# Altium project Relay-Switching-Board-v2.0.PrjPcb (part 4 of 4)

## Sheet Relay-Sheet.SchDoc
size 420 x 297 mm; SheetNumber: 5; SheetTotal: 5
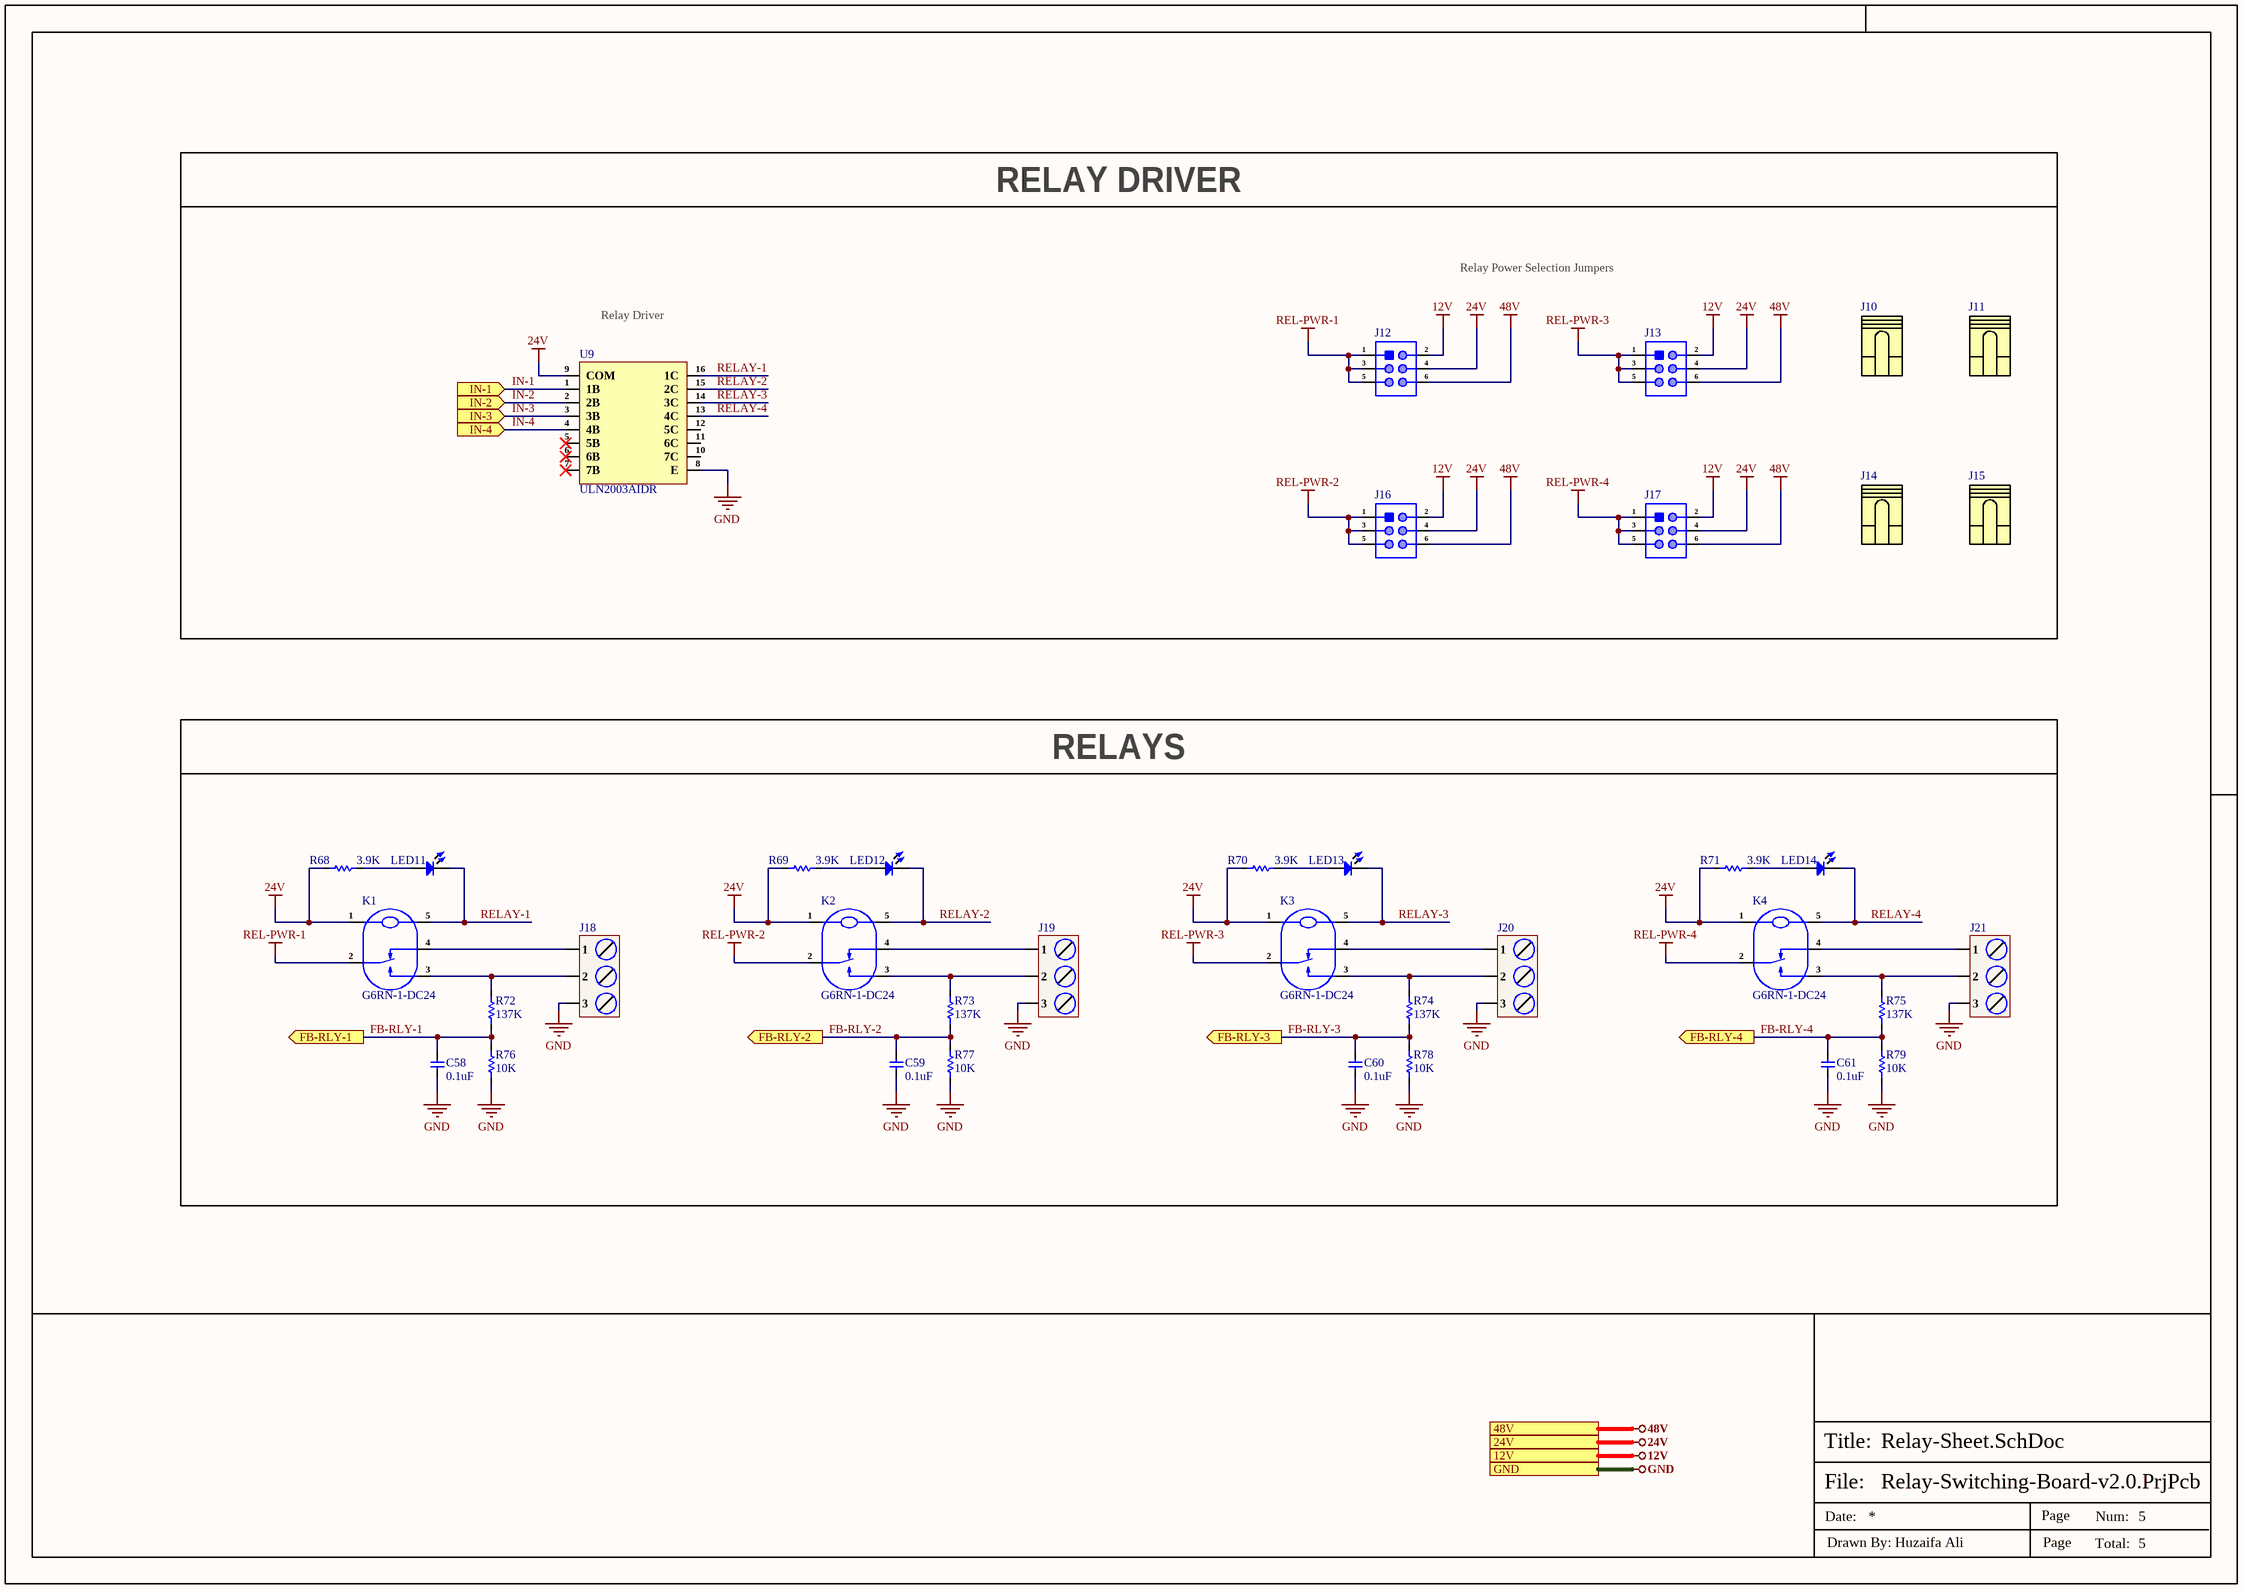
[diagram p3: Relay-Sheet.SchDoc]

### Parts
C58  0.1uF  [Cap-0603]
C59  0.1uF  [Cap-0603]
C60  0.1uF  [Cap-0603]
C61  0.1uF  [Cap-0603]
J10  Shunt (X2541-A1NIB)  (value not drawn)  (graphical)
J11  Shunt (X2541-A1NIB)  (value not drawn)  (graphical)
J12  X6521WV-2x03H-C60D30  [X6521WV-2x03H-C60D30]  (value not drawn)
J13  X6521WV-2x03H-C60D30  [X6521WV-2x03H-C60D30]  (value not drawn)
J14  Shunt (X2541-A1NIB)  (value not drawn)  (graphical)
J15  Shunt (X2541-A1NIB)  (value not drawn)  (graphical)
J16  X6521WV-2x03H-C60D30  [X6521WV-2x03H-C60D30]  (value not drawn)
J17  X6521WV-2x03H-C60D30  [X6521WV-2x03H-C60D30]  (value not drawn)
J18  DB128L-5.08-3P-GY-S  [DB128L-5.08-3P-GY-S]  (value not drawn)
J19  DB128L-5.08-3P-GY-S  [DB128L-5.08-3P-GY-S]  (value not drawn)
J20  DB128L-5.08-3P-GY-S  [DB128L-5.08-3P-GY-S]  (value not drawn)
J21  DB128L-5.08-3P-GY-S  [DB128L-5.08-3P-GY-S]  (value not drawn)
K1  G6RN-1-DC24  [G6RN-1 DC24]
K2  G6RN-1-DC24  [G6RN-1 DC24]
K3  G6RN-1-DC24  [G6RN-1 DC24]
K4  G6RN-1-DC24  [G6RN-1 DC24]
LED11  Blue  [LED-0603]  (value not drawn)
LED12  Blue  [LED-0603]  (value not drawn)
LED13  Blue  [LED-0603]  (value not drawn)
LED14  Blue  [LED-0603]  (value not drawn)
R68  3.9K  [Res-0402]
R69  3.9K  [Res-0402]
R70  3.9K  [Res-0402]
R71  3.9K  [Res-0402]
R72  137K  [Res-0402]
R73  137K  [Res-0402]
R74  137K  [Res-0402]
R75  137K  [Res-0402]
R76  10K  [Res-0402]
R77  10K  [Res-0402]
R78  10K  [Res-0402]
R79  10K  [Res-0402]
U9  ULN2003AIDR  [16-SOIC (0.154", 3.90mm Width)]

### Blocks framed on the sheet
RELAY DRIVER: J10-J17 U9
RELAYS: C58-C61 J18-J21 K1-K4 LED11-LED14 R68-R79

### Ports
12V (see Top-Sheet[5B], Power-Sheet[4D]), 24V (see Top-Sheet[5B], Power-Sheet[4D]), 48V (see Top-Sheet[5B], Power-Sheet[4D]), FB-RLY-1 (out, see Top-Sheet[4B]), FB-RLY-2 (out, see Top-Sheet[4B]), FB-RLY-3 (out, see Top-Sheet[4B]), FB-RLY-4 (out, see Top-Sheet[4B]), GND (see Top-Sheet[5B], Comms-Sheet[4D], Controller-Sheet[4D], Power-Sheet[4D]), IN-1 (in, see Top-Sheet[4B]), IN-2 (in, see Top-Sheet[4B]), IN-3 (in, see Top-Sheet[4B]), IN-4 (in, see Top-Sheet[4B])

### Nets
12V: J12.2 J13.2 J16.2 J17.2 ; port 12V
24V: J12.4 J13.4 J16.4 J17.4 K1.1 K2.1 K3.1 K4.1 R68.1 R69.1 R70.1 R71.1 U9.9(COM) ; port 24V
48V: J12.6 J13.6 J16.6 J17.6 ; port 48V
GND: C58.1 C59.1 C60.1 C61.1 J18.3 J19.3 J20.3 J21.3 R76.1 R77.1 R78.1 R79.1 U9.8(E) ; port GND
REL-PWR-1: J12.1 J12.3 J12.5 K1.2
REL-PWR-2: J16.1 J16.3 J16.5 K2.2
REL-PWR-3: J13.1 J13.3 J13.5 K3.2
REL-PWR-4: J17.1 J17.3 J17.5 K4.2
FB-RLY-1: C58.2 R72.1 R76.2 ; port FB-RLY-1  [project net DI_PA1]
FB-RLY-2: C59.2 R73.1 R77.2 ; port FB-RLY-2  [project net DI_PA5]
FB-RLY-3: C60.2 R74.1 R78.2 ; port FB-RLY-3  [project net DI_PB0]
FB-RLY-4: C61.2 R75.1 R79.2 ; port FB-RLY-4  [project net DI_PB1]
IN-1: U9.1(1B) ; port IN-1
IN-2: U9.2(2B) ; port IN-2
IN-3: U9.3(3B) ; port IN-3
IN-4: U9.4(4B) ; port IN-4
RELAY-1: K1.5 LED11.2 U9.16(1C)
RELAY-2: K2.5 LED12.2 U9.15(2C)
RELAY-3: K3.5 LED13.2 U9.14(3C)
RELAY-4: K4.5 LED14.2 U9.13(4C)
NetJ18_1: J18.1 K1.4
NetJ18_2: J18.2 K1.3 R72.2
NetJ19_1: J19.1 K2.4
NetJ19_2: J19.2 K2.3 R73.2
NetJ20_1: J20.1 K3.4
NetJ20_2: J20.2 K3.3 R74.2
NetJ21_1: J21.1 K4.4
NetJ21_2: J21.2 K4.3 R75.2
NetLED11_1: LED11.1 R68.2
NetLED12_1: LED12.1 R69.2
NetLED13_1: LED13.1 R70.2
NetLED14_1: LED14.1 R71.2

Not connected (* = marked no-connect by the designer): U9 5(5B)* 6(6B)* 7(7B)* 10(7C) 11(6C) 12(5C)

### Notes on the sheet
- Relay Power Selection Jumpers
- Relay Driver
- File:
- Title:
- Date:
- Page
- Num:
- Total:
- Drawn By: Huzaifa Ali

### Library data of the parts
C58-C61 = CC0603KRX7R0BB104: CAP CER 0.1UF 100V X7R 0603; Manufacturer: Yageo; Capacitance: 100nF; Tolerance: 10%; Item Type: Capacitor; Supplier 1: Digi-Key; Manufacturer Part Number: CC0603KRX7R0BB104; RoHS: Yes; Category: Ceramic Capacitors; Stock 1: 60476; Pricing 1: 1=0.19000, 10=0.13500, 50=0.07680, 100=0.06370, 500=0.04466, 1000=0.03696 (USD); Mount: Surface Mount; Case/Package: 0603; Case Code (Metric): 1608; Case Code (Imperial): 0603; Weight: 7.1E-05oz; Min Operating Temperature: -55°C; Max Operating Temperature: 125°C; Package Quantity: 4000; Voltage Rating: 100V; Packaging: Tape and Reel; Dielectric: X7R; Termination: SMD/SMT; Resistor Type: Ceramic; Voltage Rating (DC): 100V; Series: CC; Length: 0.063inch; Width: 0.031inch; Thickness: 0.035inch; Depth: 0.8mm; Lead Free: Lead Free; RoHS Compliant: Yes; ComponentLink1URL: https://datasheet.ciiva.com/6277/mlccorderingcode-6277030.pdf?src-supplier=Digi-Key; ComponentLink1Description: https://datasheet.ciiva.com/6277/mlccorderingcode-6277030.pdf?src-supplier=Digi-Key; ComponentLink2URL: https://datasheet.ciiva.com/6277/mlccorderingcode-6277081.pdf?src-supplier=Digi-Key; ComponentLink2Description: https://datasheet.ciiva.com/6277/mlccorderingcode-6277081.pdf?src-supplier=Digi-Key; ComponentLink3URL: https://datasheet.ciiva.com/6277/mlccorderingcode-6277082.pdf?src-supplier=Digi-Key; ComponentLink3Description: https://datasheet.ciiva.com/6277/mlccorderingcode-6277082.pdf?src-supplier=Digi-Key; Supplier Part Number 1: 311-1523-1-ND; LCSC Part Number: C113803
J10 J11 J14 J15 = Shunt (X2541-A1NIB): Open top 3A 2.54mm P=2.54mm Shunts, Jumpers ROHS; Manufacturer: XKB Connection; Item Type: Jumper; Manufacturer Part Number: X2541-A1NIB; Package: P=2.54mm; LCSC Part Number: C2938578; ComponentLink1Description: LCSC; ComponentLink1URL: https://www.lcsc.com/product-detail/Shunts-Jumpers_XKB-Connection-X2541-A1NIB_C2938578.html
J12 J13 J16 J17 = X6521WV-2x03H-C60D30: Gold 250V 3A Policy 2.5mm 6P -40℃~+105℃ 2.54mm Double Row Black Brass 2x3P 2.54mm Plugin,P=2.54mm Pin Headers ROHS; Manufacturer: XKB; Item Type: Male Pin Header; Manufacturer Part Number: X6521WV-2x03H-C60D30; Package: Plugin,P=2.54mm; LCSC Part Number: C706893; ComponentLink1Description: LCSC; ComponentLink1URL: https://www.lcsc.com/product-detail/Pin-Headers_XKB-Connection-X6521WV-2x03H-C60D30_C706893.html
J18-J21 = DB128L-5.08-3P-GY-S: 1x3P 20A -40℃~+105℃ 300V Gray 12~30 Direct Insert 5.08mm 1~2.5 1 3 Plugin,P=5.08mm Screw Terminal Blocks ROHS; Manufacturer: DORABO; Manufacturer Part Number: DB128L-5.08-3P-GY-S; Package: Plugin,P=5.08mm; LCSC Part Number: C500022; Item Type: Terminal Block; ComponentLink1Description: LCSC; ComponentLink1URL: https://www.lcsc.com/product-detail/Screw-Terminal-Blocks_DORABO-DB128L-5-08-3P-GY-S_C500022.html
K1-K4 = G6RN-1-DC24: RELAY GEN PURPOSE SPDT 8A 24V; Manufacturer: Omron; Item Type: Relays; Supplier: Rs; LCSC Part Number: C397134; Manufacturer Part Number: G6RN-1-DC24; RoHS: Yes; Stock: 2257; ComponentLink1URL: https://datasheet.ciiva.com/26921/getdatasheetpartid-770308-26921141.pdf?src-supplier=Verical; ComponentLink1Description: https://datasheet.ciiva.com/26921/getdatasheetpartid-770308-26921141.pdf?src-supplier=Verical; ComponentLink2URL: https://datasheet.ciiva.com/8000/1533700-8000602.pdf?src-supplier=Element14; ComponentLink2Description: https://datasheet.ciiva.com/8000/1533700-8000602.pdf?src-supplier=Element14; ComponentLink3URL: https://datasheet.ciiva.com/30072/en-g6rn-30072442.pdf?src-supplier=Onlinecomponents.com; ComponentLink3Description: https://datasheet.ciiva.com/30072/en-g6rn-30072442.pdf?src-supplier=Onlinecomponents.com; ComponentLink4URL: https://datasheet.ciiva.com/5232/g6rn-0911-5232733.pdf?src-supplier=Mouser; ComponentLink4Description: https://datasheet.ciiva.com/5232/g6rn-0911-5232733.pdf?src-supplier=Mouser
LED11-LED14 = NCD0603B3: blue 0603 Light Emitting Diodes (LED) ROHS; Manufacturer: Foshan NationStar Optoelectronics; Manufacturer Part Number: NCD0603B3; Package: 0603; LCSC Part Number: C158101; Item Type: LED; ComponentLink1Description: LCSC; ComponentLink1URL: https://www.lcsc.com/product-detail/Light-Emitting-Diodes-LED_Foshan-NationStar-Optoelectronics-NCD0603B3_C158101.html
R68-R71 = RC0402FR-073K9L: RES 3.9K OHM 1% 1/16W 0402; Manufacturer: Yageo; Temperature Coefficient: 100ppm/°C; Power Rating: 62.5mW; Value: 3.9kR; Voltage Rating: 50V; Max Power Dissipation: 63mW; Item Type: Resistor; Supplier: Future Electronics; Supplier Part Number: 9808155; Manufacturer Part Number: RC0402FR-073K9L; RoHS: Yes; Category: Chip SMD Resistors; Stock: 6910000; Pricing: 10000=0.0011, 100000=0.0011, 300000=0.001, 750000=0.001, 2000000=0.0009 (USD); Case/Package: 0402; Case Code (Imperial): 0402; Case Code (Metric): 1005; Min Operating Temperature: -55°C; Max Operating Temperature: 155°C; Tolerance: 1%; Packaging: Tape and Reel; Resistor Type: Thick Film; Series: RC; Termination: SMD/SMT; Number of Terminations: 2; Features: Moisture Resistant; Resistance Tolerance: 1%; Construction: Rectangular; Voltage Rating (AC): 50V; Length: 1mm; Depth: 0.5mm; Lead Free: Lead Free; RoHS Compliant: Yes; Reach SVHC Compliant: Unknown; Military Standard: Not; ComponentLink1URL: https://datasheet.ciiva.com/12666/pyu-rc0402-51-rohs-l-6-r-12666997.pdf?src-supplier=Mouser; ComponentLink1Description: https://datasheet.ciiva.com/12666/pyu-rc0402-51-rohs-l-6-r-12666997.pdf?src-supplier=Mouser; ComponentLink2URL: https://datasheet.ciiva.com/7849/1018594-7849989.pdf?src-supplier=Element14; ComponentLink2Description: https://datasheet.ciiva.com/7849/1018594-7849989.pdf?src-supplier=Element14; ComponentLink3URL: https://datasheet.ciiva.com/7849/1018594-7849990.pdf?src-supplier=Element14; ComponentLink3Description: https://datasheet.ciiva.com/7849/1018594-7849990.pdf?src-supplier=Element14; ComponentLink4URL: https://datasheet.ciiva.com/15189/getdatasheetpartid-469246-15189453.pdf?src-supplier=Verical; ComponentLink4Description: https://datasheet.ciiva.com/15189/getdatasheetpartid-469246-15189453.pdf?src-supplier=Verical; LCSC Part Number: C131467
R72-R75 = RT0402BRD07137KL: RES SMD 137K OHM 0.1% 1/16W 0402; Manufacturer: Yageo; Item Type: Resistors; Value: 137kR; Max Power Dissipation: 63mW; Temperature Coefficient: 25ppm/°C; Voltage Rating: 50V; Supplier: Digikey; LCSC Part Number: C852519; Manufacturer Part Number: RT0402BRD07137KL; RoHS: Yes; Stock: 18830; Pricing: 1=0.2, 10=0.15, 50=0.1174, 100=0.1051, 500=0.07972, 1000=0.07035, 5000=0.05199 (USD); Case/Package: 0402; Min Operating Temperature: -55°C; Max Operating Temperature: 155°C; Packaging: Tape and Reel; Number of Terminations: 2; Tolerance: 0.1%; Features: Moisture Resistant; Series: RT; Length: 0.039inch; Width: 0.02inch; Height: 0.014inch; ComponentLink1URL: http://www.yageo.com/documents/recent/PYu-RT_1-to-0.01_RoHS_L_8.pdf?src-supplier=Digikey; ComponentLink1Description: http://www.yageo.com/documents/recent/PYu-RT_1-to-0.01_RoHS_L_8.pdf?src-supplier=Digikey
R76-R79 = RT0402BRD0710KL: RES SMD 10K OHM 0.1% 1/16W 0402; Manufacturer: Yageo; Item Type: Resistor; Supplier: Future Electronics; Supplier Part Number: 1236728; Manufacturer Part Number: RT0402BRD0710KL; RoHS: Yes; Category: Chip SMD Resistors; Stock: 490000; Pricing: 10000=0.0218, 20000=0.0213, 30000=0.021, 50000=0.0206, 100000=0.0199 (USD); ComponentLink1URL: https://datasheet.ciiva.com/12836/pyu-rt-1-to-0-05-rohs-l-4-12836454.pdf?src-supplier=Mouser; ComponentLink1Description: https://datasheet.ciiva.com/12836/pyu-rt-1-to-0-05-rohs-l-4-12836454.pdf?src-supplier=Mouser; LCSC Part Number: C190095
U9 = ULN2003AIDR: IC PWR RELAY 7NPN 1:1 16SOIC; Manufacturer: Texas Instruments; Supplier: Mouser; Supplier Part Number: 595-ULN2003AIDR; Manufacturer Part Number: ULN2003AIDR; RoHS: Yes; Item Type: IC; Stock: 2012; Pricing: 1=0.66, 10=0.589, 50=0.589, 100=0.402, 1000=0.285, 10000=0.232 (USD); ComponentLink1URL: https://datasheet.ciiva.com/15139/getdatasheetpartid-47948-15139878.pdf?src-supplier=Verical; ComponentLink1Description: https://datasheet.ciiva.com/15139/getdatasheetpartid-47948-15139878.pdf?src-supplier=Verical; ComponentLink2URL: https://datasheet.ciiva.com/14424/ulq2003a-14424030.pdf?src-supplier=Avnet; ComponentLink2Description: https://datasheet.ciiva.com/14424/ulq2003a-14424030.pdf?src-supplier=Avnet; ComponentLink3URL: https://datasheet.ciiva.com/1700/uln2003ai-1700820.pdf?src-supplier=Digikey; ComponentLink3Description: https://datasheet.ciiva.com/1700/uln2003ai-1700820.pdf?src-supplier=Digikey; ComponentLink4URL: https://datasheet.ciiva.com/1700/uln2003ai-1700821.pdf?src-supplier=Digikey; ComponentLink4Description: https://datasheet.ciiva.com/1700/uln2003ai-1700821.pdf?src-supplier=Digikey; ComponentLink5URL: https://datasheet.ciiva.com/1700/uln2003ai-1700822.pdf?src-supplier=Digikey; ComponentLink5Description: https://datasheet.ciiva.com/1700/uln2003ai-1700822.pdf?src-supplier=Digikey

## Sheet Comms-Sheet.SchDoc
size 420 x 297 mm; SheetNumber: 3; SheetTotal: 5
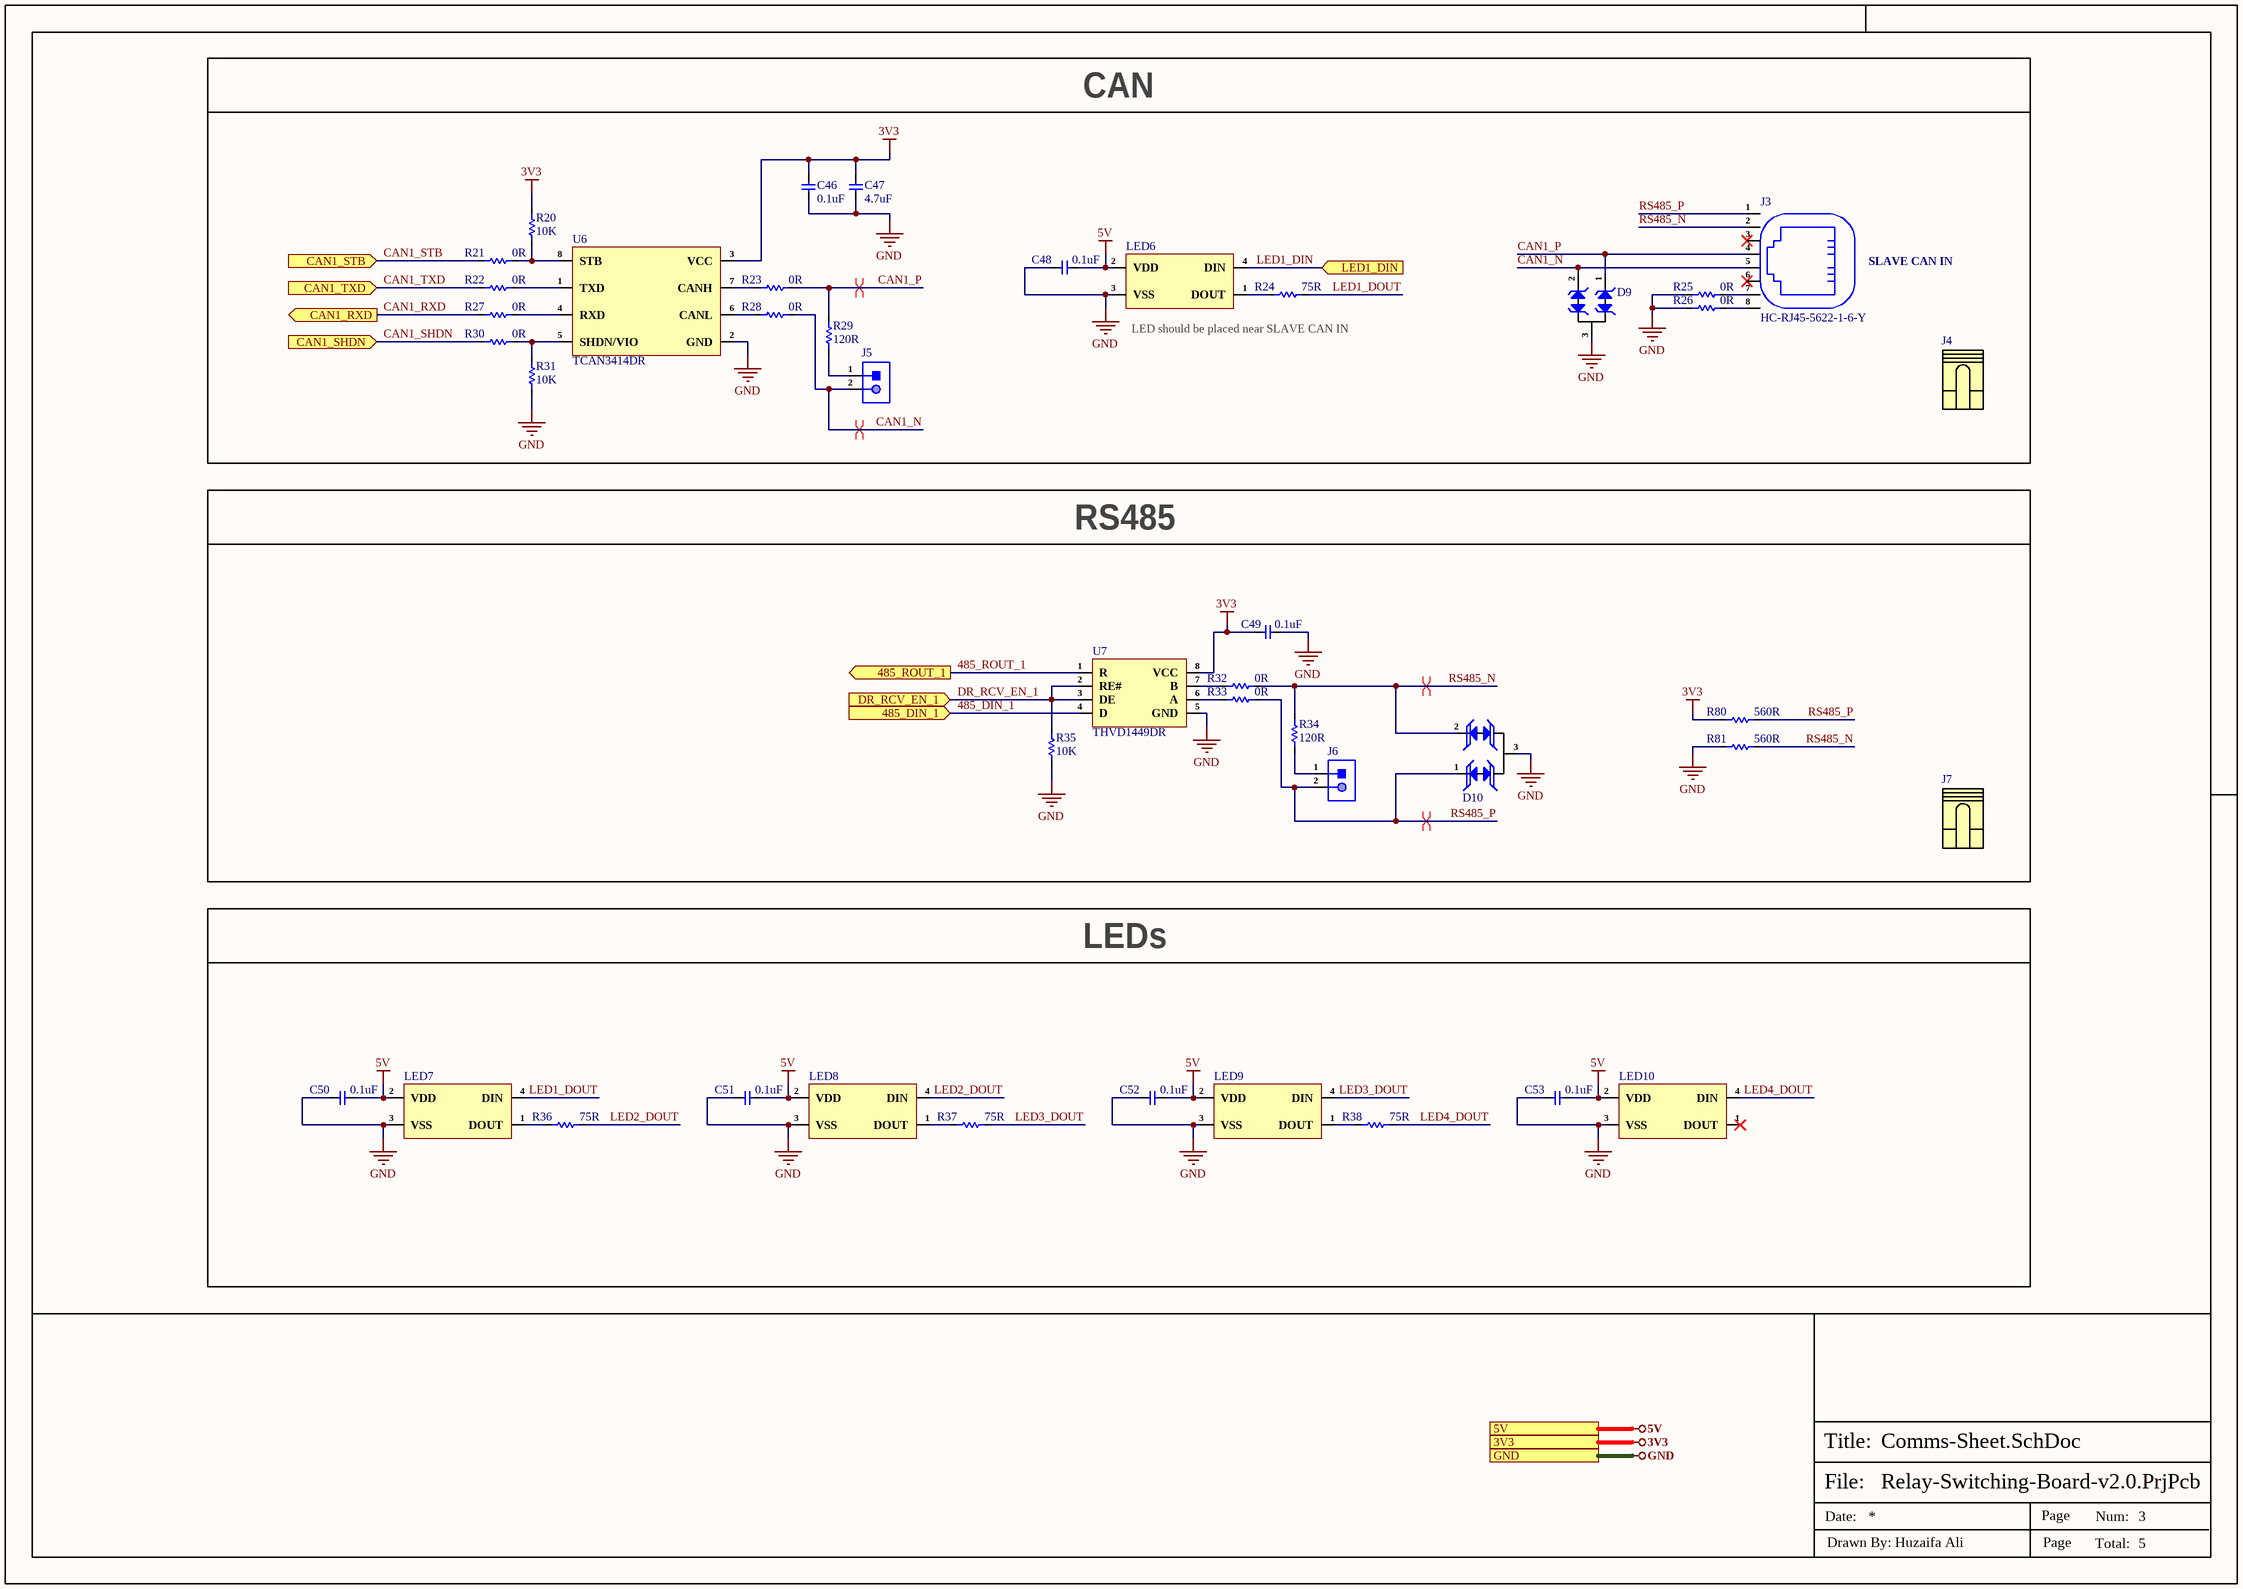
[diagram p4: Comms-Sheet.SchDoc]

### Parts
C46  0.1uF  [Cap-0402]
C47  4.7uF  [Cap-0402]
C48  0.1uF  [Cap-0402]
C49  0.1uF  [Cap-0402]
C50  0.1uF  [Cap-0402]
C51  0.1uF  [Cap-0402]
C52  0.1uF  [Cap-0402]
C53  0.1uF  [Cap-0402]
D9  CDSOT23-T24CAN-Q  [SOT-23]  (value not drawn)
D10  SM712  [SOT-23]  (value not drawn)
J3  HC-RJ45-5622-1-6-Y  [HC-RJ45-5622-1-6-Y]
J4  Shunt (X2541-A1NIB)  (value not drawn)  (graphical)
J5  X6511WV-02H-C60D30  [HDR1X2_]  (value not drawn)
J6  X6511WV-02H-C60D30  [HDR1X2_]  (value not drawn)
J7  Shunt (X2541-A1NIB)  (value not drawn)  (graphical)
LED6  WS2812D-F5  [WS2812D-F5]  (value not drawn)
LED7  WS2812D-F5  [WS2812D-F5]  (value not drawn)
LED8  WS2812D-F5  [WS2812D-F5]  (value not drawn)
LED9  WS2812D-F5  [WS2812D-F5]  (value not drawn)
LED10  WS2812D-F5  [WS2812D-F5]  (value not drawn)
R20  10K  [Res-0402]
R21  0R  [Res-0402]
R22  0R  [Res-0402]
R23  0R  [Res-0402]
R24  75R  [Res-0402]
R25  0R  [Res-0402]
R26  0R  [Res-0402]
R27  0R  [Res-0402]
R28  0R  [Res-0402]
R29  120R  [Res-0603]
R30  0R  [Res-0402]
R31  10K  [Res-0402]
R32  0R  [Res-0402]
R33  0R  [Res-0402]
R34  120R  [Res-0603]
R35  10K  [Res-0402]
R36  75R  [Res-0402]
R37  75R  [Res-0402]
R38  75R  [Res-0402]
R80  560R  [Res-0402]
R81  560R  [Res-0402]
U6  TCAN3414DR  [SOIC-8(0.154", 3.90mm Width)]
U7  THVD1449DR  [SOIC-8(0.154", 3.90mm Width)]

### Blocks framed on the sheet
CAN: C46-C48 D9 J3-J5 LED6 R20-R31 U6
RS485: C49 D10 J6 J7 R32-R35 R80 R81 U7
LEDs: C50-C53 LED7-LED10 R36-R38

### Ports
3V3 (see Top-Sheet[2B], Controller-Sheet[4D], Power-Sheet[4D]), 5V (see Top-Sheet[2B], Controller-Sheet[4D], Power-Sheet[4D]), 485_DIN_1 (in, see Top-Sheet[2B]), 485_ROUT_1 (out, see Top-Sheet[2B]), CAN1_RXD (out, see Top-Sheet[2B]), CAN1_SHDN (in, see Top-Sheet[2B]), CAN1_STB (in, see Top-Sheet[2B]), CAN1_TXD (in, see Top-Sheet[2B]), DR_RCV_EN_1 (in, see Top-Sheet[2B]), GND (see Top-Sheet[2B], Controller-Sheet[4D], Power-Sheet[4D], Relay-Sheet[4D]), LED1_DIN (in, see Top-Sheet[2B])

### Nets
3V3: C46.2 C47.2 C49.2 R20.2 R80.2 U6.3(VCC) U7.8(VCC) ; port 3V3
5V: C48.2 C50.2 C51.2 C52.2 C53.2 LED6.2(VDD) LED7.2(VDD) LED8.2(VDD) LED9.2(VDD) LED10.2(VDD) ; port 5V
GND: C46.1 C47.1 C48.1 C49.1 C50.1 C51.1 C52.1 C53.1 D9.3 D10.3(GND) LED6.3(VSS) LED7.3(VSS) LED8.3(VSS) LED9.3(VSS) LED10.3(VSS) R25.1 R26.1 R31.1 R35.2 R81.2 U6.2(GND) U7.5(GND) ; port GND
485_DIN_1: U7.4(D) ; port 485_DIN_1
485_ROUT_1: U7.1(R) ; port 485_ROUT_1
CAN1_N: D9.2 J3.5 J5.2 R28.2
CAN1_P: D9.1 J3.4 R23.2 R29.2
CAN1_RXD: R27.1 ; port CAN1_RXD
CAN1_SHDN: R30.1 ; port CAN1_SHDN
CAN1_STB: R21.1 ; port CAN1_STB
CAN1_TXD: R22.1 ; port CAN1_TXD
DR_RCV_EN_1: R35.1 U7.2(RE#) U7.3(DE) ; port DR_RCV_EN_1  [project net DO_PA15]
LED1_DIN: LED6.4(DIN) ; port LED1_DIN
LED1_DOUT: LED7.4(DIN) R24.2
LED2_DOUT: LED8.4(DIN) R36.2
LED3_DOUT: LED9.4(DIN) R37.2
LED4_DOUT: LED10.4(DIN) R38.2
RS485_N: D10.2(I/O2) J3.2 R32.2 R34.2 R81.1
RS485_P: D10.1(I/O1) J3.1 J6.2 R33.2 R80.1
NetJ3_7: J3.7 R25.2
NetJ3_8: J3.8 R26.2
NetJ5_1: J5.1 R29.1
NetJ6_1: J6.1 R34.1
NetLED6_1: LED6.1(DOUT) R24.1
NetLED7_1: LED7.1(DOUT) R36.1
NetLED8_1: LED8.1(DOUT) R37.1
NetLED9_1: LED9.1(DOUT) R38.1
NetR20_1: R20.1 R21.2 U6.8(STB)
NetR22_2: R22.2 U6.1(TXD)
NetR23_1: R23.1 U6.7(CANH)
NetR27_2: R27.2 U6.4(RXD)
NetR28_1: R28.1 U6.6(CANL)
NetR30_2: R30.2 R31.2 U6.5(SHDN/VIO)
NetR32_1: R32.1 U7.7(B)
NetR33_1: R33.1 U7.6(A)

Not connected (* = marked no-connect by the designer): J3 3* 6*; LED10 1(DOUT)*

### Layout directives
differential pair; differential pair class DIFF_RS485: RS485_N, RS485_P
differential pair; differential pair class DIFF_CAN: CAN1_N, CAN1_P

### Notes on the sheet
- SLAVE CAN IN
- LED should be placed near SLAVE CAN IN
- File:
- Title:
- Date:
- Page
- Num:
- Total:
- Drawn By: Huzaifa Ali

### Library data of the parts
C46 C48-C53 = CC0402JRX7R7BB104: CAP CER 0.1UF 16V X7R 0402; Manufacturer: Yageo; Material: 4241ConductorMaterial; Value: 100nF; Tolerance: 5%; Item Type: Capacitor; Supplier: Digikey; Supplier Part Number: 311-1676-1-ND; Manufacturer Part Number: CC0402JRX7R7BB104; RoHS: Yes; Category: Ceramic Capacitors; Stock: 1659111; Pricing: 1=0.1, 10=0.046, 50=0.0262, 100=0.0203, 500=0.01528, 1000=0.012, 2500=0.01091, 5000=0.01004 (USD); Mounting Technology: Surface Mount; Case/Package: 0402; Case Code (Metric): 1005; Case Code (Imperial): 0402; Min Operating Temperature: -55°C; Max Operating Temperature: 125°C; Dielectric: X7R; Packaging: Tape and Reel; Package Quantity: 10000; Voltage Rating (DC): 16V; Voltage Rating: 16V; Series: CC; Construction: Flat; Length: 0.039inch; Width: 0.02inch; Height: 0.5mm; Thickness: 0.022inch; Lead Free: Lead Free; Halogen Free: Halogen Free; RoHS Compliant: Yes; ComponentLink1URL: https://datasheet.ciiva.com/13210/upy-gphc-x7r-6-3v-to-50v-8-12304-13210152.pdf?src-supplier=Mouser; ComponentLink1Description: https://datasheet.ciiva.com/13210/upy-gphc-x7r-6-3v-to-50v-8-12304-13210152.pdf?src-supplier=Mouser; LCSC Part Number: C541464
C47 = CC0402KRX5R6BB475: CAP CER 4.7UF 10V X5R 0402; Manufacturer: Yageo; Tolerance: 10%; Supplier 1: Farnell; Manufacturer Part Number: CC0402KRX5R6BB475; RoHS: Yes; Category: Ceramic Capacitors; Stock 1: 20000; Pricing 1: 10000=0.02310, 50000=0.02100 (GBP); Mount: Surface Mount; Case/Package: 0402; Case Code (Imperial): 0402; Case Code (Metric): 1005; Min Operating Temperature: -55°C; Max Operating Temperature: 85°C; Packaging: Cut Tape; Capacitance: 4.7uF; Voltage Rating: 10V; RoHS Compliant: Yes; ComponentLink1URL: http://www.yageo.com/documents/recent/UPY-GPHC_X5R_4V-to-50V_25.pdf?src-supplier=Digi-Key; ComponentLink1Description: http://www.yageo.com/documents/recent/UPY-GPHC_X5R_4V-to-50V_25.pdf?src-supplier=Digi-Key; Supplier Part Number 1: 3871698; LCSC Part Number: C326586
D9 = CDSOT23-T24CAN-Q: TVS DIODE 24VWM 40VC SOT23-3; Manufacturer: Bourns; Item Type: TVS Diodes; Supplier: Digikey; LCSC Part Number: C350941; Manufacturer Part Number: CDSOT23-T24CAN-Q; RoHS: Yes; Stock: 17231; Pricing: 1=0.36, 10=0.282, 100=0.1691, 500=0.15656, 1000=0.10645, 3000=0.098, 6000=0.09393, 9000=0.08454, 30000=0.08328, 75000=0.07827 (USD); RoHS Compliant: 5897YesNo; ComponentLink1URL: http://www.farnell.com/datasheets/2372435.pdf?src-supplier=Farnell; ComponentLink1Description: http://www.farnell.com/datasheets/2372435.pdf?src-supplier=Farnell; ComponentLink2URL: https://www.bourns.com/docs/Product-Datasheets/cdsot23-t24can-Q.pdf?src-supplier=Digikey; ComponentLink2Description: https://www.bourns.com/docs/Product-Datasheets/cdsot23-t24can-Q.pdf?src-supplier=Digikey; ComponentLink3URL: http://www.farnell.com/datasheets/2372435.pdf?src-supplier=Newark; ComponentLink3Description: http://www.farnell.com/datasheets/2372435.pdf?src-supplier=Newark
D10 = SM712: SOT-23 TVS ROHS; Manufacturer: TECH PUBLIC; Item Type: Diode; Manufacturer Part Number: SM712; Package: SOT-23; LCSC Part Number: C521963; ComponentLink1Description: LCSC; ComponentLink1URL: https://www.lcsc.com/product-detail/TVS_TECH-PUBLIC-SM712_C521963.html
J3 = HC-RJ45-5622-1-6-Y: RJ45Receptacle Unshielded 1 Bend-in Gold Phosphor Bronze Without LED Plugin Ethernet Connectors / Modular Connectors (RJ45 RJ11) ROHS; Manufacturer: HCTL; Manufacturer Part Number: HC-RJ45-5622-1-6-Y; Package: Custom; LCSC Part Number: C3000205; Item Type: Ethernet Connectors; ComponentLink1Description: LCSC; ComponentLink1URL: https://www.lcsc.com/product-detail/Ethernet-Connectors-Modular-Connectors-RJ45-RJ11_HCTL-HC-RJ45-5622-1-6-Y_C3000205.html
J4 J7 = Shunt (X2541-A1NIB): as J10 on sheet Relay-Sheet; Manufacturer Part Number: X2541-A1NIB; Package: P=2.54mm; LCSC Part Number: C2938578; ComponentLink1Description: LCSC; ComponentLink1URL: https://www.lcsc.com/product-detail/Shunts-Jumpers_XKB-Connection-X2541-A1NIB_C2938578.html
J5 J6 = X6511WV-02H-C60D30: Gold 250V 3A Straight Square Pins 2.5mm 2P 260℃ 6mm -40℃~+105℃ 3mm 2.54mm Plugin Black Brass 1x2P Plugin,P=2.54mm Pin Headers ROHS; Manufacturer: XKB; Item Type: Male Header; Manufacturer Part Number: X6511WV-02H-C60D30; Package: Plugin,P=2.54mm; LCSC Part Number: C706874; ComponentLink1Description: LCSC; ComponentLink1URL: https://www.lcsc.com/product-detail/Pin-Headers_XKB-Connectivity-X6511WV-02H-C60D30_C706874.html
LED6-LED10 = WS2812D-F5: Plugin,D=5mm RGB LEDs ROHS; Manufacturer: Worldsemi; Item Type: RGB LED; Manufacturer Part Number: WS2812D-F5; Package: Plugin,D=5mm; LCSC Part Number: C190565; ComponentLink1Description: LCSC; ComponentLink1URL: https://jlcpcb.com/partdetail/Worldsemi-WS2812DF5/C190565
R20 R31 R35 = RC0402FR-0710KL: RES 10K OHM 1% 1/16W 0402; Manufacturer: Yageo; Resistance: 10kR; Voltage Rating (DC): 50V; Temperature Coefficient: 100ppm/°C; Power Rating: 62.5mW; Max Power Dissipation: 63mW; Item Type: Resistor; Supplier 1: Mouser; Manufacturer Part Number: RC0402FR-0710KL; RoHS: Yes; Category: Chip SMD Resistors; Stock 1: 18648329; Pricing 1: 1=0.10000, 10=0.01400, 50=0.01400, 100=0.00500, 1000=0.00300, 10000=0.00200 (USD); Case/Package: 0402; Number of Pins: 2; Case Code (Imperial): 0402; Case Code (Metric): 1005; Min Operating Temperature: -55°C; Max Operating Temperature: 155°C; Resistor Type: Thick Film; Tolerance: 1%; Packaging: Tape and Reel; Voltage Rating: 50V; Termination: SMD/SMT; Working Voltage: 50V; Number of Terminations: 2; Features: Moisture Resistant; Series: RC; Resistance Tolerance: 1%; Construction: Rectangular; Length: 1mm; Width: 0.5mm; Height: 0.32mm; Depth: 0.5mm; Lead Pitch: 0.2mm; REACH SVHC: No SVHC; Lead Free: Lead Free; RoHS Compliant: Yes; Military Standard: Not; ComponentLink1URL: https://datasheet.ciiva.com/7660/38568-7660787.pdf?src-supplier=Element14; ComponentLink1Description: https://datasheet.ciiva.com/7660/38568-7660787.pdf?src-supplier=Element14; ComponentLink2URL: https://datasheet.ciiva.com/7849/1686128-7849814.pdf?src-supplier=Element14; ComponentLink2Description: https://datasheet.ciiva.com/7849/1686128-7849814.pdf?src-supplier=Element14; ComponentLink3URL: https://datasheet.ciiva.com/7983/1018594-7983486.pdf?src-supplier=Element14; ComponentLink3Description: https://datasheet.ciiva.com/7983/1018594-7983486.pdf?src-supplier=Element14; ComponentLink4URL: https://datasheet.ciiva.com/22747/1018594-22747512.pdf?src-supplier=Element14; ComponentLink4Description: https://datasheet.ciiva.com/22747/1018594-22747512.pdf?src-supplier=Element14; ComponentLink5URL: https://datasheet.ciiva.com/12667/pyu-rc0402-51-rohs-l-6-r-12667067.pdf?src-supplier=Mouser; ComponentLink5Description: https://datasheet.ciiva.com/12667/pyu-rc0402-51-rohs-l-6-r-12667067.pdf?src-supplier=Mouser; ComponentLink6URL: https://datasheet.ciiva.com/7849/1784430-7849813.pdf?src-supplier=Element14; ComponentLink6Description: https://datasheet.ciiva.com/7849/1784430-7849813.pdf?src-supplier=Element14; ComponentLink7URL: https://datasheet.ciiva.com/7849/1784430-7849815.pdf?src-supplier=Element14; ComponentLink7Description: https://datasheet.ciiva.com/7849/1784430-7849815.pdf?src-supplier=Element14; Supplier Part Number 1: 603-RC0402FR-0710KL; LCSC Part Number: C60490
R21-R23 R25-R28 R30 R32 R33 = RC0402FR-070RL: RES 0 OHM JUMPER 1/16W 0402; Manufacturer: Yageo; Item Type: Resistors; Tolerance: 1%; Power Rating: 62.5mW; Voltage Rating: 50V; Temperature Coefficient: 200ppm/°C; Max Power Dissipation: 63mW; Supplier 1: Mouser; Manufacturer Part Number: RC0402FR-070RL; RoHS: Yes; Stock 1: 8556842; Pricing 1: 1=0.10000, 10=0.01400, 50=0.01400, 100=0.00600, 1000=0.00300, 5000=0.00200, 10000=0.00100 (USD); Mount: Surface Mount; Case/Package: 0402; Contact Plating: Tin,Matte; Case Code (Imperial): 0402; Case Code (Metric): 1005; Size Code: 0402; Min Operating Temperature: -55°C; Max Operating Temperature: 155°C; Resistance: 0R; Resistor Type: Thick Film; Packaging: Tape and Reel; Termination: SMD/SMT; Features: Moisture Resistant; Series: RC; Number of Terminations: 2; Length: 1mm; Width: 0.5mm; Height: 0.35mm; Radiation Hardening: No; Lead Free: Lead Free; RoHS Compliant: Yes; ComponentLink1URL: https://datasheet.ciiva.com/8896/pyu-rc0402-51-rohs-l-6-8896149.pdf?src-supplier=Avnet; ComponentLink1Description: https://datasheet.ciiva.com/8896/pyu-rc0402-51-rohs-l-6-8896149.pdf?src-supplier=Avnet; ComponentLink2URL: https://datasheet.ciiva.com/16790/pyu-rc0402-51-rohs-l-6-r-16790444.pdf?src-supplier=Future+Electronics; ComponentLink2Description: https://datasheet.ciiva.com/16790/pyu-rc0402-51-rohs-l-6-r-16790444.pdf?src-supplier=Future+Electronics; Supplier Part Number 1: 603-RC0402FR-070RL; LCSC Part Number: C106231
R24 R36-R38 = RC0402JR-0775RL: RES 75 OHM 5% 1/16W 0402; Manufacturer: Yageo; Item Type: Resistor; Temperature Coefficient: 100ppm/°C; Power Rating: 62.5mW; Voltage Rating: 50V; Max Power Dissipation: 63mW; Supplier: Digikey; Supplier Part Number: 311-75JRCT-ND; Manufacturer Part Number: RC0402JR-0775RL; RoHS: Yes; Stock: 2993323; Pricing: 1=0.1, 10=0.018, 50=0.0102, 100=0.0083, 500=0.00528, 1000=0.00444, 5000=0.00307 (USD); Case/Package: 0402; Pins: 2; Contact Plating: Tin,Lead; Case Code (Imperial): 0402; Case Code (Metric): 1005; Min Operating Temperature: -55°C; Max Operating Temperature: 155°C; Value: 75R; Tolerance: 5%; Resistor Type: Thick Film; Packaging: Tape and Reel; Termination: SMD/SMT; Voltage Rating (DC): 50V; Features: Moisture Resistant; Series: RC; Number of Terminations: 2; Resistance Tolerance: 5%; Length: 1mm; Width: 0.5mm; Height: 0.35mm; Reach SVHC Compliant: No; Lead Free: Lead Free; RoHS Compliant: Yes; ComponentLink1URL: https://datasheet.ciiva.com/7983/1018594-7983612.pdf?src-supplier=Element14; ComponentLink1Description: https://datasheet.ciiva.com/7983/1018594-7983612.pdf?src-supplier=Element14; ComponentLink2URL: https://datasheet.ciiva.com/17082/pyu-rc0402-51-rohs-l-6-r-17082239.pdf?src-supplier=Future+Electronics; ComponentLink2Description: https://datasheet.ciiva.com/17082/pyu-rc0402-51-rohs-l-6-r-17082239.pdf?src-supplier=Future+Electronics; LCSC Part Number: C137841
R29 R34 = RC0603FR-07120RL: RES 120 OHM 1% 1/10W 0603; Manufacturer: Yageo; Temperature Coefficient: 100ppm/°C; Voltage Rating (DC): 50V; Power Rating: 100mW; Item Type: Resistor; Supplier 1: Digi-Key; Manufacturer Part Number: RC0603FR-07120RL; RoHS: Yes; Category: Chip SMD Resistors; Stock 1: 839061; Pricing 1: 1=0.10000, 10=0.02400, 100=0.00970, 1000=0.00436, 2500=0.00378 (USD); Case/Package: 0603; Number of Pins: 2; Case Code (Metric): 1608; Case Code (Imperial): 0603; Size Code: 0603; Min Operating Temperature: -55°C; Max Operating Temperature: 155°C; Resistance: 120R; Tolerance: 1%; Resistor Type: Thick Film; Packaging: Tape and Reel; Voltage Rating: 50V; Package Quantity: 1; Number of Terminations: 2; Termination: SMD/SMT; Max Power Dissipation: 100mW; Features: Moisture Resistant; Series: RC; Construction: Rectangular; Resistance Tolerance: 1%; Length: 1.6mm; Width: 0.031inch; Height: 0.022inch; Depth: 0.8mm; REACH SVHC: No SVHC; Lead Free: Lead Free; Military Standard: Not; RoHS Compliant: Yes; ComponentLink1URL: https://datasheet.ciiva.com/2553/pyu-r-int-thick-7-2553512.pdf?src-supplier=Digi-Key; ComponentLink1Description: https://datasheet.ciiva.com/2553/pyu-r-int-thick-7-2553512.pdf?src-supplier=Digi-Key; ComponentLink2URL: https://datasheet.ciiva.com/7746/443971-7746248.pdf?src-supplier=Element14; ComponentLink2Description: https://datasheet.ciiva.com/7746/443971-7746248.pdf?src-supplier=Element14; ComponentLink3URL: https://datasheet.ciiva.com/2553/pyu-r-int-thick-7-2553513.pdf?src-supplier=Digi-Key; ComponentLink3Description: https://datasheet.ciiva.com/2553/pyu-r-int-thick-7-2553513.pdf?src-supplier=Digi-Key; ComponentLink4URL: https://datasheet.ciiva.com/7746/443971-7746249.pdf?src-supplier=Element14; ComponentLink4Description: https://datasheet.ciiva.com/7746/443971-7746249.pdf?src-supplier=Element14; ComponentLink5URL: https://datasheet.ciiva.com/2553/pyu-r-int-thick-7-2553514.pdf?src-supplier=Digi-Key; ComponentLink5Description: https://datasheet.ciiva.com/2553/pyu-r-int-thick-7-2553514.pdf?src-supplier=Digi-Key; ComponentLink6URL: https://datasheet.ciiva.com/46395/443971-46395021.pdf?src-supplier=Element14; ComponentLink6Description: https://datasheet.ciiva.com/46395/443971-46395021.pdf?src-supplier=Element14; Supplier Part Number 1: 311-120HRCT-ND; LCSC Part Number: C114640
R80 R81 = RC0402FR-07560RL: RES 560 OHM 1% 1/16W 0402; Manufacturer: Yageo; Power Rating: 63mW; Temperature Coefficient: 100ppm/°C; Voltage Rating: 50V; Item Type: Resistor; Supplier: Future Electronics; Supplier Part Number: 8872046; Manufacturer Part Number: RC0402FR-07560RL; RoHS: Yes; Category: Chip SMD Resistors; Stock: 1360000; Pricing: 10000=0.0012, 100000=0.0011, 300000=0.0011, 1250000=0.001, 3000000=0.0009 (USD); Case/Package: 0402; Case Code (Metric): 1005; Case Code (Imperial): 0402; Min Operating Temperature: -55°C; Max Operating Temperature: 155°C; Tolerance: 1%; Packaging: Tape and Reel; Value: 560R; Package Quantity: 1; Resistor Type: Thick Film; Number of Terminations: 2; Termination: SMD/SMT; Max Power Dissipation: 63mW; Features: Moisture Resistant; Series: RC; Construction: Rectangular; Resistance Tolerance: 1%; Length: 1mm; Width: 0.02inch; Height: 0.016inch; Depth: 0.5mm; RoHS Compliant: Yes; Military Standard: Not; Lead Free: Lead Free; Reach SVHC Compliant: Unknown; ComponentLink1URL: https://datasheet.ciiva.com/2453/pyu-r-int-thick-7-2453458.pdf?src-supplier=Digikey; ComponentLink1Description: https://datasheet.ciiva.com/2453/pyu-r-int-thick-7-2453458.pdf?src-supplier=Digikey; ComponentLink2URL: https://datasheet.ciiva.com/2453/pyu-r-int-thick-7-2453459.pdf?src-supplier=Digikey; ComponentLink2Description: https://datasheet.ciiva.com/2453/pyu-r-int-thick-7-2453459.pdf?src-supplier=Digikey; ComponentLink3URL: https://datasheet.ciiva.com/2453/pyu-r-int-thick-7-2453457.pdf?src-supplier=Digikey; ComponentLink3Description: https://datasheet.ciiva.com/2453/pyu-r-int-thick-7-2453457.pdf?src-supplier=Digikey; ComponentLink4URL: https://datasheet.ciiva.com/12558/pyu-rc0402-51-rohs-l-6-r-8721-12558383.pdf?src-supplier=Mouser; ComponentLink4Description: https://datasheet.ciiva.com/12558/pyu-rc0402-51-rohs-l-6-r-8721-12558383.pdf?src-supplier=Mouser; ComponentLink5URL: https://datasheet.ciiva.com/7850/1018594-7850042.pdf?src-supplier=Element14; ComponentLink5Description: https://datasheet.ciiva.com/7850/1018594-7850042.pdf?src-supplier=Element14; ComponentLink6URL: https://datasheet.ciiva.com/7850/1018594-7850043.pdf?src-supplier=Element14; ComponentLink6Description: https://datasheet.ciiva.com/7850/1018594-7850043.pdf?src-supplier=Element14; LCSC Part Number: C163460
U6 = TCAN3414DR: IC TRANSCEIVER HALF 1/1 8SOIC; Manufacturer: Texas Instruments; Supplier: Mouser; LCSC Part Number: C22396693; Manufacturer Part Number: TCAN3414DR; RoHS: No; Item Type: IC; Stock: 201; Pricing: 1=1.55, 10=1.1, 50=1.1, 100=0.895, 1000=0.763, 10000=0.681 (USD); Case/Package: SOIC; Pins: 8; Length: 4.9mm; Width: 3.91mm; Height: 1.75mm; Thickness: 1.58mm
U7 = THVD1449DR: IC TRANSCEIVER HALF 1/1 8SOIC; Manufacturer: Texas Instruments; Supplier: Mouser; LCSC Part Number: C3235059; Manufacturer Part Number: THVD1449DR; RoHS: No; Item Type: IC; Stock: 7454; Pricing: 1=3.62, 10=2.51, 50=2.51, 100=2.27, 1000=2.02, 10000=1.95 (USD)

## Nets that join several sheets
3V3: Power-Sheet (D8.2 F1.2 R19.1), Controller-Sheet (11 pins), Comms-Sheet (7 pins)
5V: Power-Sheet (10 pins), Controller-Sheet (R66.2), Comms-Sheet (10 pins)
12V: Power-Sheet (D6.3 R18.1), Relay-Sheet (J12.2 J13.2 J16.2 J17.2)
24V: Power-Sheet (31 pins), Relay-Sheet (13 pins)
48V: Power-Sheet (D2.3 R10.1), Relay-Sheet (J12.6 J13.6 J16.6 J17.6)
GND: Power-Sheet (66 pins), Controller-Sheet (13 pins), Relay-Sheet (13 pins), Comms-Sheet (22 pins)
485_DIN_1: Controller-Sheet (R43.1), Comms-Sheet (U7.4)
485_ROUT_1: Controller-Sheet (R45.1), Comms-Sheet (U7.1)
CAN1_RXD: Controller-Sheet (R57.1), Comms-Sheet (R27.1)
CAN1_SHDN: Controller-Sheet (R63.1), Comms-Sheet (R30.1)
CAN1_STB: Controller-Sheet (R62.1), Comms-Sheet (R21.1)
CAN1_TXD: Controller-Sheet (R58.1), Comms-Sheet (R22.1)
DI_PA1: Controller-Sheet (R41.1), Relay-Sheet (C58.2 R72.1 R76.2)
DI_PA5: Controller-Sheet (R50.1), Relay-Sheet (C59.2 R73.1 R77.2)
DI_PB0: Controller-Sheet (R40.1), Relay-Sheet (C60.2 R74.1 R78.2)
DI_PB1: Controller-Sheet (R42.1), Relay-Sheet (C61.2 R75.1 R79.2)
DO_PA15: Controller-Sheet (R61.1), Comms-Sheet (R35.1 U7.2 U7.3)
IN-1: Controller-Sheet (R46.1), Relay-Sheet (U9.1)
IN-2: Controller-Sheet (R48.1), Relay-Sheet (U9.2)
IN-3: Controller-Sheet (R52.1), Relay-Sheet (U9.3)
IN-4: Controller-Sheet (R56.1), Relay-Sheet (U9.4)
LED1_DIN: Controller-Sheet (R67.2), Comms-Sheet (LED6.4)